# Altium schematic sheet TMC4671_Section.SchDoc: =Projectname
size A4; SheetNumber: 2; SheetTotal: 7
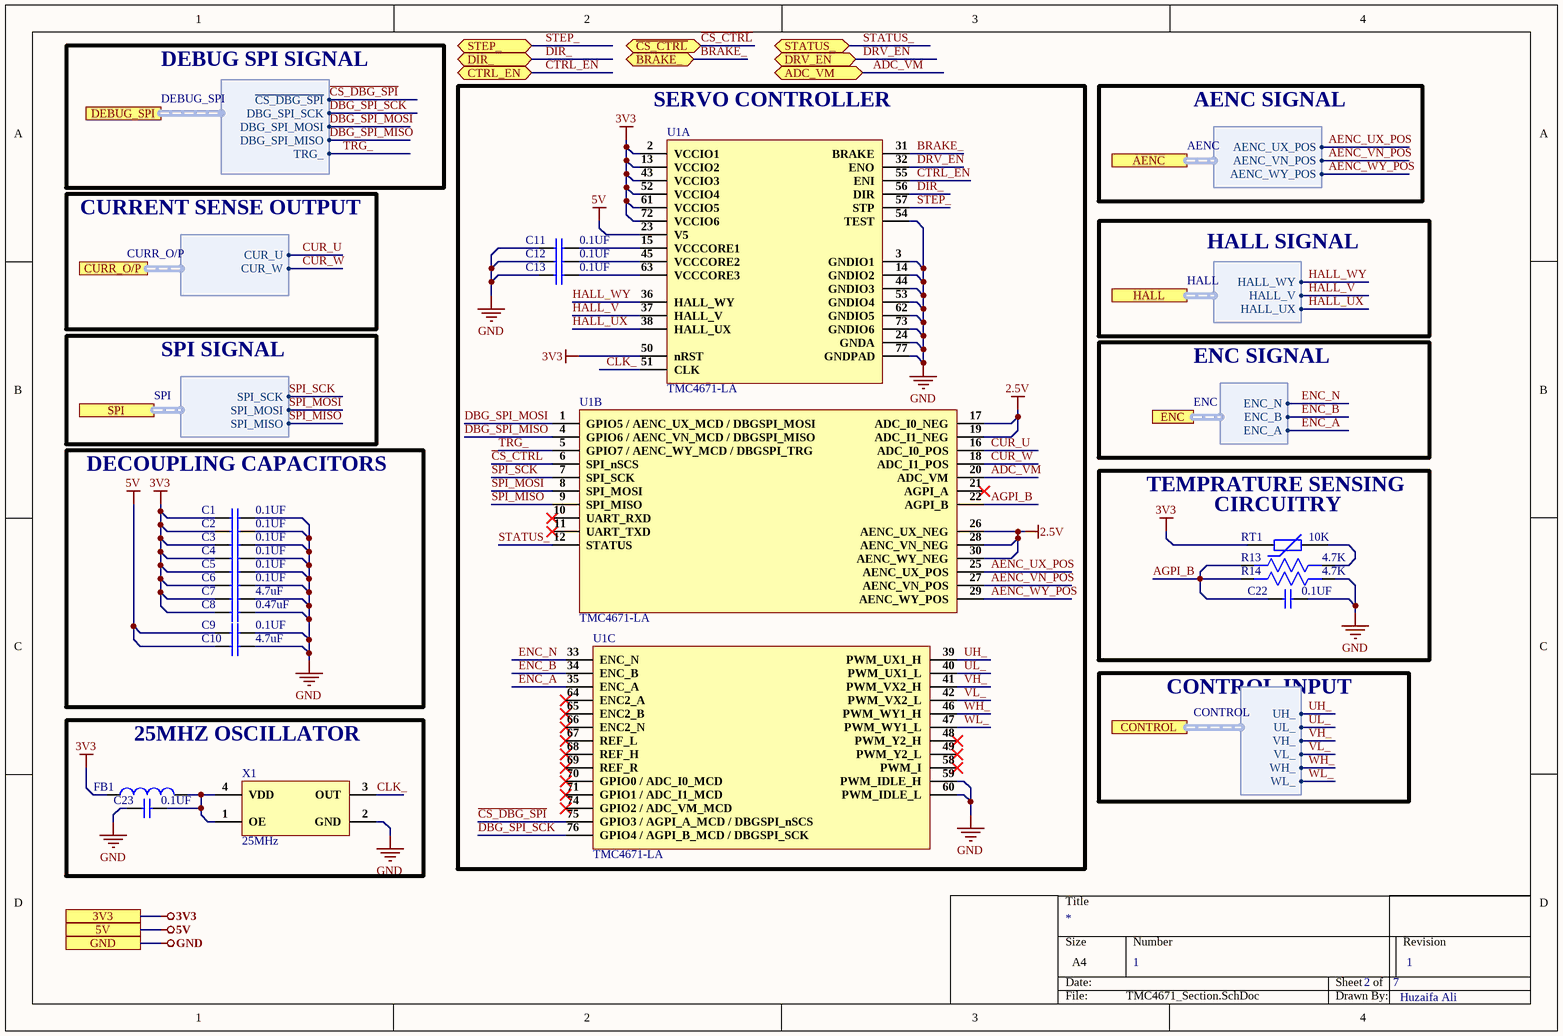
[diagram p0: TMC4671_Section.SchDoc]

## Parts
C1  0.1UF  [Cap0402]
C2  0.1UF  [Cap0402]
C3  0.1UF  [Cap0402]
C4  0.1UF  [Cap0402]
C5  0.1UF  [Cap0402]
C6  0.1UF  [Cap0402]
C7  4.7uF  [Cap0603]
C8  0.47uF  [Cap0603]
C9  0.1UF  [Cap0402]
C10  4.7uF  [Cap0603]
C11  0.1UF  [Cap0402]
C12  0.1UF  [Cap0402]
C13  0.1UF  [Cap0402]
C22  0.1UF  [Cap0402]
C23  0.1UF  [Cap0402]
FB1  742792651  [IND 0603]  (value not drawn)
R13  4.7K  [Res0603]
R14  4.7K  [Res0603]
RT1  10K  [Res0603]
U1  TMC4671-LA  [76-QFN (10.5x6.5)]  (parts A,B,C of 3)
X1  25MHz  [SX3M25.000M20F30TNN]

## Blocks framed on the sheet
SERVO CONTROLLER: C11-C13 U1
DECOUPLING CAPACITORS: C1-C10
25MHZ OSCILLATOR: C23 FB1 X1

## Ports
3V3, 5V, ADC_VM (bidir), AENC (harness AENC), BRAKE_ (bidir), CONTROL (harness CONTROL), CTRL_EN (bidir), CURR_O/P (harness CURR_O/P), DEBUG_SPI (harness DEBUG_SPI), DIR_ (bidir), DRV_EN (bidir), ENC (harness ENC), GND, HALL (harness HALL), SPI (harness SPI), STATUS_ (bidir), STEP_ (bidir), ~{CS_CTRL} (bidir)

## Harnesses
DEBUG_SPI: ~{CS_DBG_SPI}, DBG_SPI_SCK, DBG_SPI_MOSI, DBG_SPI_MISO, TRG_
SPI: SPI_SCK, SPI_MOSI, SPI_MISO
ENC: ENC_N, ENC_B, ENC_A
HALL: HALL_WY, HALL_V, HALL_UX
CURR_O/P: CUR_U, CUR_W
AENC: AENC_UX_POS, AENC_VN_POS, AENC_WY_POS
CONTROL: UH_, UL_, VH_, VL_, WH_, WL_

## Nets
2.5V: U1.17(ADC_I0_NEG) U1.19(ADC_I1_NEG) U1.26(AENC_UX_NEG) U1.28(AENC_VN_NEG) U1.30(AENC_WY_NEG)
3V3: C1.1 C2.1 C3.1 C4.1 C5.1 C6.1 C7.1 C8.1 FB1.1 RT1.1 U1.2(VCCIO1) U1.13(VCCIO2) U1.43(VCCIO3) U1.50(nRST) U1.52(VCCIO4) U1.61(VCCIO5) U1.72(VCCIO6) ; port 3V3
5V: C9.1 C10.1 U1.23(V5) ; port 5V
GND: C1.2 C2.2 C3.2 C4.2 C5.2 C6.2 C7.2 C8.2 C9.2 C10.2 C11.1 C12.1 C13.1 C22.2 C23.1 R14.1 U1.3(GNDIO1) U1.14(GNDIO2) U1.24(GNDA) U1.44(GNDIO3) U1.53(GNDIO4) U1.54(TEST) U1.59(PWM_IDLE_H) U1.60(PWM_IDLE_L) U1.62(GNDIO5) U1.73(GNDIO6) U1.77(GNDPAD) X1.2(GND) ; port GND
~{CS_CTRL}: U1.6(SPI_nSCS) ; port ~{CS_CTRL}
~{CS_DBG_SPI}: U1.75(GPIO3_/_AGPI_A_MCD_/_DBGSPI_nSCS) ; port DEBUG_SPI.~{CS_DBG_SPI}
ADC_VM: U1.20(ADC_VM) ; port ADC_VM
AENC_UX_POS: U1.25(AENC_UX_POS) ; port AENC.AENC_UX_POS
AENC_VN_POS: U1.27(AENC_VN_POS) ; port AENC.AENC_VN_POS
AENC_WY_POS: U1.29(AENC_WY_POS) ; port AENC.AENC_WY_POS
AGPI_B: C22.1 R13.2 R14.2 U1.22(AGPI_B)
BRAKE_: U1.31(BRAKE) ; port BRAKE_
CLK_: U1.51(CLK) X1.3(OUT)
CTRL_EN: U1.55(ENI) ; port CTRL_EN
CUR_U: U1.16(ADC_I0_POS) ; port CURR_O/P.CUR_U
CUR_W: U1.18(ADC_I1_POS) ; port CURR_O/P.CUR_W
DBG_SPI_MISO: U1.4(GPIO6_/_AENC_VN_MCD_/_DBGSPI_MISO) ; port DEBUG_SPI.DBG_SPI_MISO
DBG_SPI_MOSI: U1.1(GPIO5_/_AENC_UX_MCD_/_DBGSPI_MOSI) ; port DEBUG_SPI.DBG_SPI_MOSI
DBG_SPI_SCK: U1.76(GPIO4_/_AGPI_B_MCD_/_DBGSPI_SCK) ; port DEBUG_SPI.DBG_SPI_SCK
DIR_: U1.56(DIR) ; port DIR_
DRV_EN: U1.32(ENO) ; port DRV_EN
ENC_A: U1.35(ENC_A) ; port ENC.ENC_A
ENC_B: U1.34(ENC_B) ; port ENC.ENC_B
ENC_N: U1.33(ENC_N) ; port ENC.ENC_N
HALL_UX: U1.38(HALL_UX) ; port HALL.HALL_UX
HALL_V: U1.37(HALL_V) ; port HALL.HALL_V
HALL_WY: U1.36(HALL_WY) ; port HALL.HALL_WY
SPI_MISO: U1.9(SPI_MISO) ; port SPI.SPI_MISO
SPI_MOSI: U1.8(SPI_MOSI) ; port SPI.SPI_MOSI
SPI_SCK: U1.7(SPI_SCK) ; port SPI.SPI_SCK
STATUS_: U1.12(STATUS) ; port STATUS_
STEP_: U1.57(STP) ; port STEP_
TRG_: U1.5(GPIO7_/_AENC_WY_MCD_/_DBGSPI_TRG) ; port DEBUG_SPI.TRG_
UH_: U1.39(PWM_UX1_H) ; port CONTROL.UH_
UL_: U1.40(PWM_UX1_L) ; port CONTROL.UL_
VH_: U1.41(PWM_VX2_H) ; port CONTROL.VH_
VL_: U1.42(PWM_VX2_L) ; port CONTROL.VL_
WH_: U1.46(PWM_WY1_H) ; port CONTROL.WH_
WL_: U1.47(PWM_WY1_L) ; port CONTROL.WL_
NetC11_2: C11.2 U1.15(VCCCORE1)
NetC12_2: C12.2 U1.45(VCCCORE2)
NetC13_2: C13.2 U1.63(VCCCORE3)
NetC23_2: C23.2 FB1.2 X1.1(OE) X1.4(VDD)
NetR13_1: R13.1 RT1.2

Not connected (* = marked no-connect by the designer): U1 10(UART_RXD)* 11(UART_TXD)* 21(AGPI_A)* 48(PWM_Y2_H)* 49(PWM_Y2_L)* 58(PWM_I)* 64(ENC2_A)* 65(ENC2_B)* 66(ENC2_N)* 67(REF_L)* 68(REF_H)* 69(REF_R)* 70(GPIO0_/_ADC_I0_MCD)* 71(GPIO1_/_ADC_I1_MCD)* 74(GPIO2_/_ADC_VM_MCD)*

## Notes on the sheet
- DEBUG SPI SIGNAL
- AENC SIGNAL
- CURRENT SENSE OUTPUT
- HALL SIGNAL
- SPI SIGNAL
- ENC SIGNAL
- TEMPRATURE SENSING
- (near RT1) CIRCUITRY
- CONTROL INPUT
- 1
- Huzaifa Ali

## Library data of the parts
C1-C6 C9 C11-C13 C22 C23 = CL05B104KB54PNC: CAP CER 0.1UF 50V X7R 0402; Manufacturer: Samsung; Supplier 1: Digi-Key; Manufacturer Part Number: CL05B104KB54PNC; Stock 1: 8594; Pricing 1: 1=0.1, 10=0.067, 50=0.0366, 100=0.0299, 500=0.02138, 1000=0.01681, 2500=0.01528, 5000=0.01406 (USD); Supplier Part Number 1: 1276-CL05B104KB54PNCDKR-ND
C7 C10 = GRM188R61C475KAAJD: CAP CER 4.7UF 16V X5R 0603; Manufacturer: Murata; Material: Ceramic; Tolerance: 10%; Supplier 1: Digi-Key; Manufacturer Part Number: GRM188R61C475KAAJD; Stock 1: 407631; Pricing 1: 1=0.35, 10=0.246, 100=0.1473, 500=0.1105, 1000=0.09331 (USD); Mount: Surface Mount; Case/Package: 0603; Weight: 0.000222oz; Case Code (Metric): 1608; Case Code (Imperial): 0603; Min Operating Temperature: -55°C; Max Operating Temperature: 85°C; Capacitance: 4.7uF; Packaging: Tape and Reel; Dielectric: X5R; Voltage Rating: 16V; Termination: SMD/SMT; Voltage Rating (DC): 16V; Package Quantity: 4000; Length: 1.6mm; Height: 0.8mm; Width: 0.8mm; Thickness: 0.037inch; Depth: 0.8mm; REACH SVHC: No SVHC; Lead Free: Lead Free; ComponentLink1URL: http://components.arrow.com/part/dataview/50250782S9718068N2606?src-supplier=Arrow; ComponentLink1Description: http://components.arrow.com/part/dataview/50250782S9718068N2606?src-supplier=Arrow; Supplier Part Number 1: 490-10481-1-ND
C8 = UMK107B7474KA-TR: CAP CER 0.47uF 50V X7R 0603; Manufacturer: Taiyo Yuden; Tolerance: 10%; Capacitance: 470nF; Supplier 1: Digi-Key; Manufacturer Part Number: UMK107B7474KA-TR; RoHS: Yes; Category: Ceramic Capacitors; Stock 1: 81; Pricing 1: 1=0.21000, 10=0.14800, 50=0.08400, 100=0.06950, 500=0.04876, 1000=0.04036 (USD); Mount: Surface Mount; Case/Package: 0603; Case Code (Metric): 1608; Case Code (Imperial): 0603; Min Operating Temperature: -55°C; Max Operating Temperature: 125°C; Packaging: Tape and Reel; Voltage Rating: 50V; Package Quantity: 1; Dielectric: X7R; Termination: SMD/SMT; Voltage: 50V; Series: M; Voltage Rating (DC): 50V; Construction: Flat; Length: 1.6mm; Width: 0.031inch; Height: 0.8mm; Depth: 0.8mm; Thickness: 0.035inch; Radiation Hardening: No; RoHS Compliant: Yes; Lead Free: Lead Free; Halogen Free: Halogen Free; ComponentLink1URL: https://datasheet.ciiva.com/30063/972umk107b7474ka-tr-30063804.pdf?src-supplier=Onlinecomponents.com; ComponentLink1Description: https://datasheet.ciiva.com/30063/972umk107b7474ka-tr-30063804.pdf?src-supplier=Onlinecomponents.com; ComponentLink2URL: https://datasheet.ciiva.com/11600/umk107b7474ka-tr-ss-11600367.pdf?src-supplier=Avnet; ComponentLink2Description: https://datasheet.ciiva.com/11600/umk107b7474ka-tr-ss-11600367.pdf?src-supplier=Avnet; ComponentLink3URL: https://datasheet.ciiva.com/15922/257umk107b7474ka-tr-15922607.pdf?src-supplier=Onlinecomponents.com; ComponentLink3Description: https://datasheet.ciiva.com/15922/257umk107b7474ka-tr-15922607.pdf?src-supplier=Onlinecomponents.com; ComponentLink4URL: https://datasheet.ciiva.com/6274/mlcc-all-e-6274710.pdf?src-supplier=Digi-Key; ComponentLink4Description: https://datasheet.ciiva.com/6274/mlcc-all-e-6274710.pdf?src-supplier=Digi-Key; ComponentLink5URL: https://datasheet.ciiva.com/5412/mlcc01-e-5412119.pdf?src-supplier=Mouser; ComponentLink5Description: https://datasheet.ciiva.com/5412/mlcc01-e-5412119.pdf?src-supplier=Mouser; ComponentLink6URL: https://datasheet.ciiva.com/6274/mlcc-all-e-6274712.pdf?src-supplier=Digi-Key; ComponentLink6Description: https://datasheet.ciiva.com/6274/mlcc-all-e-6274712.pdf?src-supplier=Digi-Key; ComponentLink7URL: https://datasheet.ciiva.com/6274/mlcc-all-e-6274713.pdf?src-supplier=Digi-Key; ComponentLink7Description: https://datasheet.ciiva.com/6274/mlcc-all-e-6274713.pdf?src-supplier=Digi-Key; Supplier Part Number 1: 587-3170-1-ND
FB1 = 742792651: Ferrite Beads WE-CBF 0603 SMD Bead 100MHz 600Ohm 1000mA; Manufacturer: Wurth Electronics; Tolerance: 25%; Current Rating: 1A; Impedance: 600R; Number of Lines: 1; DC Resistance (DCR): 200mR; Inductance: 0.36H; Supplier 1: RSComponents; Manufacturer Part Number: 742792651; RoHS: Yes; Category: Ferrite Beads and Chips; Stock 1: 6200; Pricing 1: 50=0.13400, 500=0.12400, 2500=0.11200, 5000=0.10000, 12500=0.09000 (GBP); Mount: Surface Mount; Case/Package: SMD/SMT; Case Code (Metric): 1608; Case Code (Imperial): 0603; Material: Ferrite; Core Material: Ferrite; Weight: 0.000141oz; Min Operating Temperature: -55°C; Max Operating Temperature: 125°C; Package Quantity: 1; Packaging: Tape and Reel; Max Current Rating: 1A; Max DC Current: 1A; Termination: SMD/SMT; Test Frequency: 100MHz; Series: WE-CBF; Resistance: 200mR; Length: 1.6mm; Width: 0.8mm; Height: 0.8mm; Depth: 0.8mm; REACH SVHC: Unknown; RoHS Compliant: Yes; Lead Free: Lead Free; ComponentLink1URL: https://datasheet.ciiva.com/1475/1705833-1475349.pdf?src-supplier=Farnell; ComponentLink1Description: https://datasheet.ciiva.com/1475/1705833-1475349.pdf?src-supplier=Farnell; ComponentLink2URL: https://datasheet.ciiva.com/11803/0900766b80d2e079-11803680.pdf?src-supplier=RSComponents; ComponentLink2Description: https://datasheet.ciiva.com/11803/0900766b80d2e079-11803680.pdf?src-supplier=RSComponents; ComponentLink3URL: https://datasheet.ciiva.com/4940/742792651-72243-4940492.pdf?src-supplier=Mouser; ComponentLink3Description: https://datasheet.ciiva.com/4940/742792651-72243-4940492.pdf?src-supplier=Mouser; ComponentLink4URL: https://datasheet.ciiva.com/1013/742792651-1013527.pdf?src-supplier=Digi-Key; ComponentLink4Description: https://datasheet.ciiva.com/1013/742792651-1013527.pdf?src-supplier=Digi-Key; ComponentLink5URL: https://datasheet.ciiva.com/22711/1705833-22711420.pdf?src-supplier=Element14; ComponentLink5Description: https://datasheet.ciiva.com/22711/1705833-22711420.pdf?src-supplier=Element14; ComponentLink6URL: https://datasheet.ciiva.com/1013/742792651-1013528.pdf?src-supplier=Digi-Key; ComponentLink6Description: https://datasheet.ciiva.com/1013/742792651-1013528.pdf?src-supplier=Digi-Key; ComponentLink7URL: https://datasheet.ciiva.com/1013/742792651-1013529.pdf?src-supplier=Digi-Key; ComponentLink7Description: https://datasheet.ciiva.com/1013/742792651-1013529.pdf?src-supplier=Digi-Key; Supplier Part Number 1: 1241835
R13 R14 = RC0603FR-074K7L: RES SMD 4.7K OHM 1% 1/10W 0603; Manufacturer: Yageo; Resistance: 4.7kR; Temperature Coefficient: 100ppm/°C; Power Rating: 100mW; Voltage Rating (DC): 50V; Supplier 1: Digi-Key; Manufacturer Part Number: RC0603FR-074K7L; Stock 1: 5337567; Pricing 1: 1=0.1, 10=0.023, 100=0.0094, 1000=0.00421, 2500=0.00366 (USD); Case/Package: 0603; Number of Pins: 2; Case Code (Imperial): 0603; Case Code (Metric): 1608; Min Operating Temperature: -55°C; Max Operating Temperature: 155°C; Tolerance: 1%; Composition: Thick Film; Packaging: Tape and Reel; Voltage Rating: 50V; Termination: SMD/SMT; Military Standard: Not; Length: 1.6mm; Height: 0.45mm; Width: 0.8mm; Depth: 0.8mm; Lead Pitch: 0.3mm; REACH SVHC: No SVHC; Lead Free: Lead Free; ComponentLink1URL: https://www.verical.com/server-webapp/html/getDatasheet?partID=422754&src-supplier=Verical; ComponentLink1Description: https://www.verical.com/server-webapp/html/getDatasheet?partID=422754&src-supplier=Verical; ComponentLink2URL: http://www.farnell.com/datasheets/2167052.pdf?src-supplier=Element14; ComponentLink2Description: http://www.farnell.com/datasheets/2167052.pdf?src-supplier=Element14; ComponentLink3URL: http://www.farnell.com/datasheets/38590.pdf?src-supplier=Element14; ComponentLink3Description: http://www.farnell.com/datasheets/38590.pdf?src-supplier=Element14; ComponentLink4URL: http://www.farnell.com/datasheets/1868787.pdf?src-supplier=Element14; ComponentLink4Description: http://www.farnell.com/datasheets/1868787.pdf?src-supplier=Element14; Supplier Part Number 1: 311-4.70KHRCT-ND
RT1 = NCP18XH103F03RB: THERMISTOR NTC 10KOHM 3380K 0603; Manufacturer: Murata; Manufacturer Series: NCP18; Number of Terminals/Pins: 2; Resistance: 10kR; Tolerance: 1%; Power Rating: 100mW; Current Rating: 310uA; Accuracy: 0.7%; Thermistor Application: TEMPERATURE COMPENSATION; Supplier 1: Arrow Electronics; Manufacturer Part Number: NCP18XH103F03RB; RoHS: Yes; Category: Thermistors; Stock 1: 60000; Pricing 1: 4000=0.08160 (USD); Mount: Surface Mount; Case/Package: 0603; Number of Pins: 2; Case Code (Metric): 1608; Case Code (Imperial): 0603; Terminal Finish: Tin; Package Shape: Rectangular; Min Operating Temperature: -40°C; Max Operating Temperature: 125°C; Packaging: Tape and Reel; Package Quantity: 1; Termination: SMD/SMT; Max Power Dissipation: 100mW; Series: NCP; Resistance Tolerance: 1%; Terminal Placement: Dual; Length: 1.6mm; Height: 0.8mm; Depth: 0.8mm; Radiation Hardening: No; REACH SVHC: No SVHC; Lead Free: Lead Free; RoHS Compliant: Yes; ComponentLink1URL: https://datasheet.ciiva.com/11822/0900766b807f1e39-11822112.pdf?src-supplier=RSComponents; ComponentLink1Description: https://datasheet.ciiva.com/11822/0900766b807f1e39-11822112.pdf?src-supplier=RSComponents; ComponentLink2URL: https://datasheet.ciiva.com/4504/r44e-3685-4504704.pdf?src-supplier=Mouser; ComponentLink2Description: https://datasheet.ciiva.com/4504/r44e-3685-4504704.pdf?src-supplier=Mouser; ComponentLink3URL: https://datasheet.ciiva.com/2848/r44e-2848446.pdf?src-supplier=Digi-Key; ComponentLink3Description: https://datasheet.ciiva.com/2848/r44e-2848446.pdf?src-supplier=Digi-Key; ComponentLink4URL: https://datasheet.ciiva.com/2848/r44e-2848445.pdf?src-supplier=Digi-Key; ComponentLink4Description: https://datasheet.ciiva.com/2848/r44e-2848445.pdf?src-supplier=Digi-Key; ComponentLink5URL: https://datasheet.ciiva.com/2848/r44e-2848447.pdf?src-supplier=Digi-Key; ComponentLink5Description: https://datasheet.ciiva.com/2848/r44e-2848447.pdf?src-supplier=Digi-Key; ComponentLink6URL: https://datasheet.ciiva.com/3280/l0770e-3280679.pdf?src-supplier=Avnet; ComponentLink6Description: https://datasheet.ciiva.com/3280/l0770e-3280679.pdf?src-supplier=Avnet; ComponentLink7URL: https://datasheet.ciiva.com/16469/l0770e-16469741.pdf?src-supplier=Future+Electronics; ComponentLink7Description: https://datasheet.ciiva.com/16469/l0770e-16469741.pdf?src-supplier=Future+Electronics; ComponentLink8URL: https://datasheet.ciiva.com/17993/getdatasheetpartid-153236-17993210.pdf?src-supplier=Verical; ComponentLink8Description: https://datasheet.ciiva.com/17993/getdatasheetpartid-153236-17993210.pdf?src-supplier=Verical; Supplier Part Number 1: NCP18XH103F03RB
U1 = TMC4671-LA: SERVO CONTROLLER IC, QFN76; Manufacturer: Trinamic; Supplier 1: Mouser; Manufacturer Part Number: TMC4671-LA; RoHS: No; Category: Motor Drivers; Pricing 1: 1=12.54000, 10=11.53000, 25=11.05000, 50=11.05000, 100=9.26000, 261=8.66000, 522=8.05000, 1000=8.05000, 1044=7.64000, 10000=7.64000 (USD); Supplier Part Number 1: 700-TMC4671-LA
X1 = SX3M25.000M20F30TNN: 1.62V~3.63V -40℃~+85℃ 10mA ±20ppm CMOS 25MHz SMD3225-4P Oscillators ROHS; Manufacturer: SCTF Elec; ComponentLink1Description: LCSC; ComponentLink1URL: https://lcsc.com/product-detail/Oscillators_Shenzhen-SCTF-Elec-SX3M25-000M20F30TNN_C2901575.html; Manufacturer Part Number: SX3M25.000M20F30TNN; Footprint: Custom